# EasyEDA Pro project esp-college-project_bkymsryt-aeef78a5.epro, schematic SCH-ShuttleBoard-BMI270&BMM350-V1_2
Board Name: ShuttleBoard-BMI270&BMM350-V1_1; Create Date: 2025-10-21; Page Name: P1; Project Name: ESP-SensairShuttle; Schematic Name: SCH-ShuttleBoard-BMI270&BMM350-V1_1; Update Date: 2025-10-21; Company: Espressif
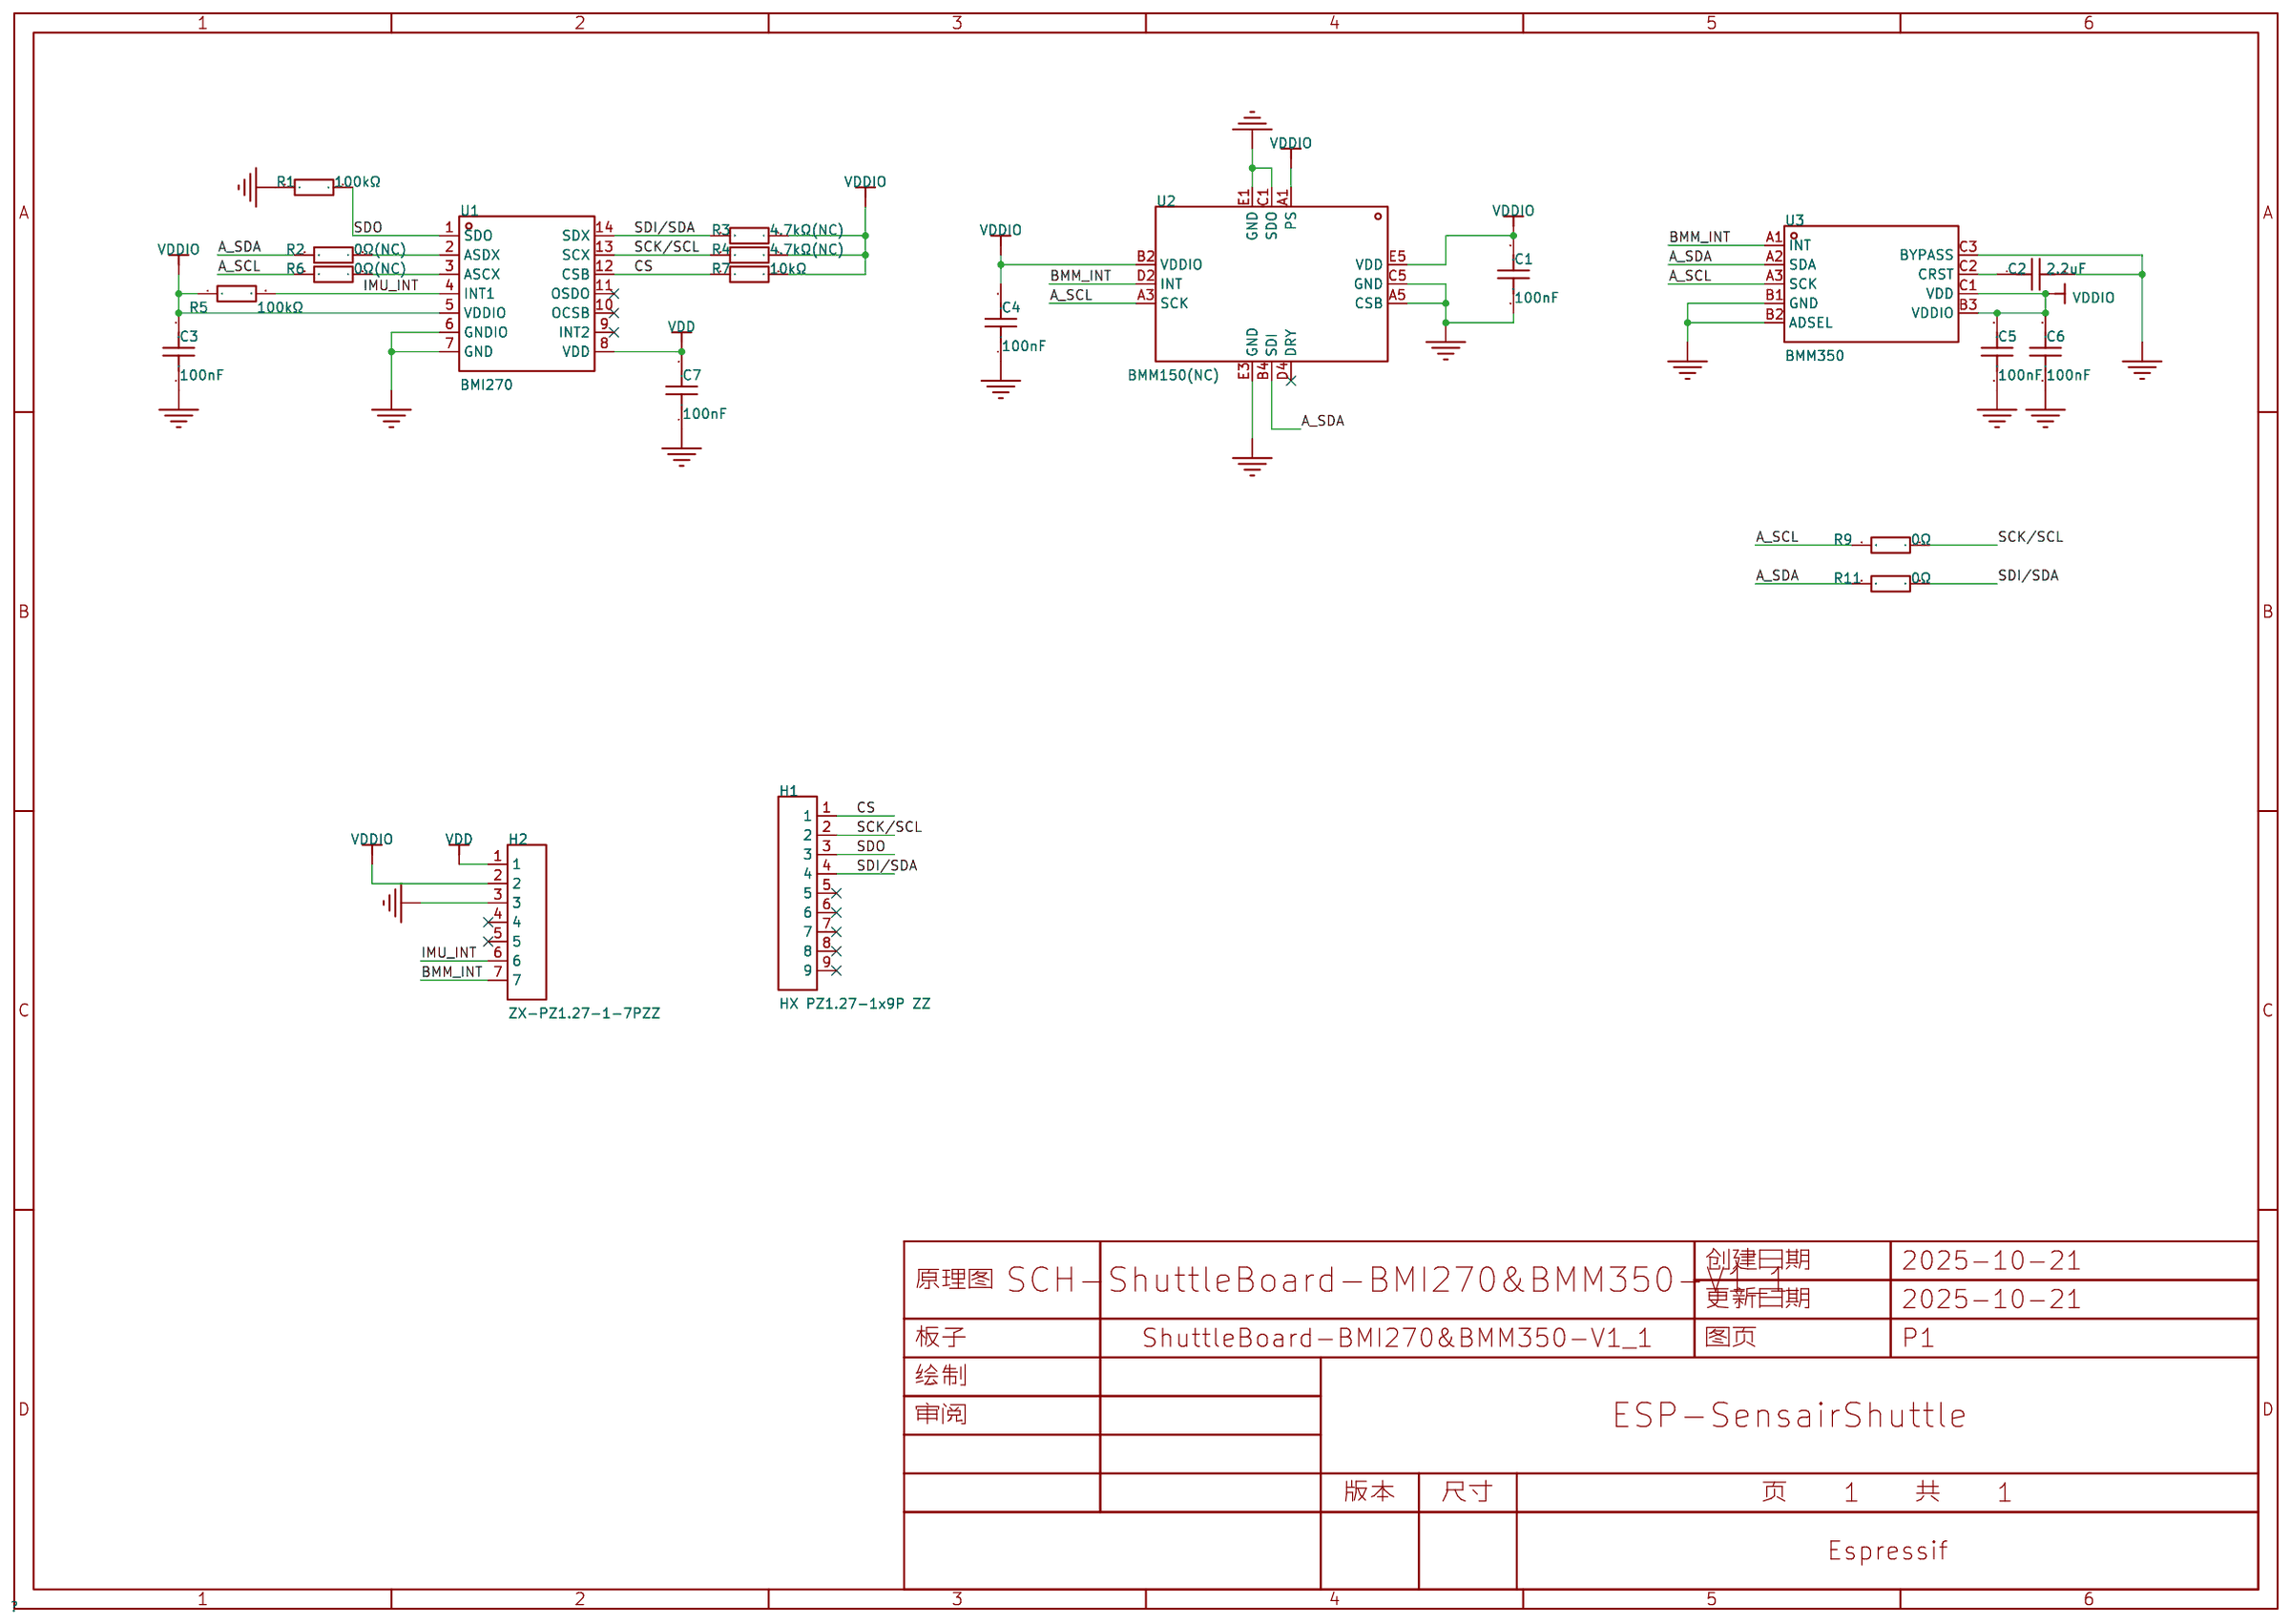
[diagram p0: schematic sheet]

## Parts
C1  100nF  [C0402]
C2  2.2uF  [C0402]
C3  100nF  [C0402]
C4  100nF  [C0402]
C5  100nF  [C0402]
C6  100nF  [C0402]
C7  100nF  [C0402]
H1  HX PZ1.27-1x9P ZZ  [HDR-TH_9P-P1.27-V-M]
H2  ZX-PZ1.27-1-7PZZ  [HDR-TH_7P-P1.27-V-M-2]
R1  100kΩ  [R0402_1]
R2  0Ω(NC)  [R0402_1]
R3  4.7kΩ(NC)  [R0402]
R4  4.7kΩ(NC)  [R0402]
R5  100kΩ  [R0402_1]
R6  0Ω(NC)  [R0402_1]
R7  10kΩ  [R0402_1]
R9  0Ω  [R0402_1]
R11  0Ω  [R0402_1]
U1  BMI270  [LGA-14_L3.0-W2.5-P0.50-BR]
U2  BMM150(NC)  [WLCSP-12_L1.6-W1.6_BMM150]
U3  BMM350  [WLCSP-9_L1.3-W1.3-R3-C3-P0.40-TL]

## Library data of the parts
C1 C3-C7 = CL05B104KO5NNNC: 容值:100nF;精度:±10%;额定电压:16V;材质(温度系数):X7R;; LCSC Part Name: 100nF ±10% 16V; Supplier Part: C1525; Manufacturer: SAMSUNG(三星); Supplier Footprint: 0402; JLCPCB Part Class: 基础库; Datasheet: https://atta.szlcsc.com/upload/public/pdf/source/20160218/1457707763339.pdf; Supplier: LCSC; Tolerance: ±10%; Voltage Rated: 16V; Temperature Coefficient: X7R
C2 = CL05A225MQ5NSNC: 容值:2.2uF;精度:±20%;额定电压:6.3V;材质(温度系数):X5R;; LCSC Part Name: 2.2uF ±20% 6.3V; Supplier Part: C12530; Manufacturer: SAMSUNG(三星); Supplier Footprint: 0402; JLCPCB Part Class: Basic Part; Datasheet: https://atta.szlcsc.com/upload/public/pdf/source/20160218/1457707763339.pdf; Supplier: LCSC; Tolerance: ±20%; Voltage Rated: 6.3V; Temperature Coefficient: X5R
H1 = HX PZ1.27-1x9P ZZ: 插针结构:1x9P;间距:1.27mm;行距:-;圆针/方针:方针;安装方式:直插;排数:单排;总PIN位数:9P;额定电流:1A;额定电压:-;配合针长度:3.9mm;塑高:1mm;端接针长度:2.3mm;触头材质:磷青铜;触头镀层:金;工作温度:-40℃~+105℃;颜色:黑色;; LCSC Part Name: 1x9P 间距:1.27mm 方针 直插; Supplier Part: C22438106; Manufacturer: hanxia(韩下); Supplier Footprint: 插件,P=1.27mm; JLCPCB Part Class: 扩展库; Datasheet: https://atta.szlcsc.com/upload/public/pdf/source/20240522/EDC4EB74ABA2F7724AE2DA5150C3160E.pdf; Supplier: LCSC; Pin Structure: 1x9P; Pitch: 1.27mm; Circluar Pins/Square Pins: 方针; Mounting Type: 直插; Number of Rows: 单排; Number of Pins: 9P; Current Rating: 1A; Length of Mating Pin: 3.9mm; Insulation Height: 1mm; Length of End Connection Pin: 2.3mm; Contact Material: 磷青铜; Contact Plating: 金; Operating Temperature: -40℃~+105℃; Color: 黑色
H2 = ZX-PZ1.27-1-7PZZ: 插针结构:1x7P;间距:1.27mm;行距:-;圆针/方针:方针;安装方式:直插;排数:单排;总PIN位数:7P;额定电流:1A;额定电压:-;配合针长度:3.9mm;塑高:1mm;端接针长度:2.3mm;触头材质:黄铜;触头镀层:金;工作温度:-40℃~+105℃;颜色:黑色;; LCSC Part Name: 1x7P 间距:1.27mm 方针 直插; Supplier Part: C41370739; Manufacturer: Megastar(兆星); Supplier Footprint: 插件,P=1.27mm; JLCPCB Part Class: 扩展库; Datasheet: https://atta.szlcsc.com/upload/public/pdf/source/20240828/99A84DD00A3C3BDAF37BC6A7479E534F.pdf; Supplier: LCSC; Pin Structure: 1x7P; Pitch: 1.27mm; Circluar Pins/Square Pins: 方针; Mounting Type: 直插; Number of Rows: 单排; Number of Pins: 7P; Current Rating: 1A; Length of Mating Pin: 3.9mm; Insulation Height: 1mm; Length of End Connection Pin: 2.3mm; Contact Material: 黄铜; Contact Plating: 金; Operating Temperature: -40℃~+105℃; Color: 黑色
R1 R5 = 0402WGF1003TCE: 电阻类型:厚膜电阻;阻值:100kΩ;精度:±1%;功率:62.5mW;最大工作电压:50V;温度系数:±100ppm/℃;; LCSC Part Name: 100kΩ ±1% 62.5mW 厚膜电阻; Supplier Part: C25741; Manufacturer: UNI-ROYAL(厚声); Supplier Footprint: 0402; JLCPCB Part Class: Basic Part; Datasheet: https://atta.szlcsc.com/upload/public/pdf/source/20200306/C422600_1E6D84923E4A46A82E41ADD87F860B5C.pdf; Supplier: LCSC; Type: 厚膜电阻; Tolerance: ±1%; Power(Watts): 62.5mW; Temperature Coefficient: ±100ppm/℃; Overload Voltage (Max): 50V; Operating Temperature Range: -55℃~+155℃; Check: false
R2 R6 = 0402WGF0000TCE: 电阻类型:厚膜电阻;阻值:0Ω;精度:±1%;功率:62.5mW;工作电压:50V;温度系数:±800ppm/℃;; LCSC Part Name: 0Ω ±1% 62.5mW 厚膜电阻; Supplier Part: C17168; Manufacturer: UNI-ROYAL(厚声); Supplier Footprint: 0402; JLCPCB Part Class: Basic Part; Datasheet: https://atta.szlcsc.com/upload/public/pdf/source/20200306/C422600_1E6D84923E4A46A82E41ADD87F860B5C.pdf; Supplier: LCSC; Type: 厚膜电阻; Tolerance: ±1%; Power(Watts): 62.5mW; Temperature Coefficient: ±800ppm/℃; Overload Voltage (Max): 50V; Operating Temperature Range: -55℃~+155℃; Voltage-Supply(Max): 50V; Operating Temperature: -55℃~+155℃; Check: false
R3 R4 = 0402WGF4701TCE: 电阻类型:厚膜电阻;阻值:4.7kΩ;精度:±1%;功率:62.5mW;工作电压:50V;温度系数:±100ppm/℃;; LCSC Part Name: 4.7kΩ ±1% 62.5mW 厚膜电阻; Supplier Part: C25900; Manufacturer: UNI-ROYAL(厚声); Supplier Footprint: 0402; JLCPCB Part Class: Basic Part; Datasheet: https://item.szlcsc.com/datasheet/0402WGF4701TCE/26643.html; Supplier: LCSC; Type: 厚膜电阻; Tolerance: ±1%; Power(Watts): 62.5mW; Overload Voltage (Max): 50V; Temperature Coefficient: ±100ppm/℃; Operating Temperature Range: -55℃~+155℃; Voltage-Supply(Max): 50V; Operating Temperature: -55℃~+155℃; Check: false
R7 = 0402WGF1002TCE: 电阻类型:厚膜电阻;阻值:10kΩ;精度:±1%;功率:62.5mW;最大工作电压:50V;温度系数:±100ppm/℃;; LCSC Part Name: 厚膜电阻 10kΩ ±1% 62.5mW; Supplier Part: C25744; Manufacturer: UNI-ROYAL(厚声); Supplier Footprint: 0402; JLCPCB Part Class: Basic Part; Datasheet: https://atta.szlcsc.com/upload/public/pdf/source/20200306/C422600_1E6D84923E4A46A82E41ADD87F860B5C.pdf; Supplier: LCSC; Type: 厚膜电阻; Tolerance: ±1%; Power(Watts): 62.5mW; Temperature Coefficient: ±100ppm/℃; Overload Voltage (Max): 50V; Operating Temperature Range: -55℃~+155℃
R9 R11 = 0402WGF0000TCE: 电阻类型:厚膜电阻;阻值:0Ω;精度:±1%;功率:62.5mW;工作电压:50V;温度系数:±800ppm/℃;; LCSC Part Name: 0Ω ±1% 62.5mW; Supplier Part: C17168; Manufacturer: UNI-ROYAL(厚声); Supplier Footprint: 0402; JLCPCB Part Class: Basic Part; Datasheet: https://atta.szlcsc.com/upload/public/pdf/source/20200306/C422600_1E6D84923E4A46A82E41ADD87F860B5C.pdf; Supplier: LCSC; Type: 厚膜电阻; Tolerance: ±1%; Power(Watts): 62.5mW; Temperature Coefficient: ±800ppm/℃; Overload Voltage (Max): 50V; Operating Temperature Range: -55℃~+155℃; Voltage-Supply(Max): 50V; Operating Temperature: -55℃~+155℃
U1 = BMI270: 传感器类型:加速度计陀螺仪;; Supplier Part: C2836813; Manufacturer: Bosch(博世); Supplier Footprint: LGA-14(2.5x3); JLCPCB Part Class: 扩展库; Datasheet: https://atta.szlcsc.com/upload/public/pdf/source/20210625/C2836813_35E1F3F92097F45A3828DF13DDBA01A5.pdf; Supplier: LCSC; Sensor Type: 加速度计陀螺仪; Operating Temperature: -40℃~+85℃
U2 = BMM150: 磁传感器 3轴磁罗盘; LCSC Part Name: 三轴地磁式传感器 停产; Supplier Part: C171681; Manufacturer: Bosch(博世); Supplier Footprint: WLCSP-12(1.6x1.6); JLCPCB Part Class: 扩展库; Datasheet: https://atta.szlcsc.com/upload/public/pdf/source/20180327/C171681_AC95244FE88EF9D8F701E0ABF38F9AC1.pdf; Supplier: LCSC; Check: false
U3 = BMM350_C17225907: LCSC Part Name: SHUTTLE BOARD 3.0 BMM350; Supplier Part: C17225907; Manufacturer: Bosch(博世); JLCPCB Part Class: 扩展库; Datasheet: https://atta.szlcsc.com/upload/public/pdf/source/231023/C17225907-4fe553158356ca54352d40639207ed12.pdf; Supplier: LCSC

## Nets
GND: C1.1 C2.2 C3.1 C4.1 C5.1 C6.1 C7.1 H2.3 R1.1 U1.6(GNDIO) U1.7(GND) U2.A5(CSB) U2.C1(SDO) U2.C5(GND) U2.E1(GND) U2.E3(GND) U3.B1(GND) U3.B2(ADSEL) U3.C3(BYPASS)
VDD: C7.2 H2.1 U1.8(VDD)
VDDIO: C1.2 C3.2 C4.2 C5.2 C6.2 H2.2 R3.1 R4.1 R5.1 R7.2 U1.5(VDDIO) U2.A1(PS) U2.B2(VDDIO) U2.E5(VDD) U3.B3(VDDIO) U3.C1(VDD)
A_SCL: R6.2 R9.2 U2.A3(SCK) U3.A3(SCK)
A_SDA: R2.2 R11.2 U2.B4(SDI) U3.A2(SDA)
BMM_INT: H2.7 U2.D2(INT) U3.A1(INT)
CS: H1.1 R7.1 U1.12(CSB)
IMU_INT: H2.6 R5.2 U1.4(INT1)
SCK/SCL: H1.2 R4.2 R9.1 U1.13(SCX)
SDI/SDA: H1.4 R3.2 R11.1 U1.14(SDX)
SDO: H1.3 R1.2 U1.1(SDO)
$1N576: R6.1 U1.3(ASCX)
$1N584: R2.1 U1.2(ASDX)
$1N2196: C2.1 U3.C2(CRST)

Not connected (* = marked no-connect by the designer): H1 5* 6* 7* 8* 9*; H2 4* 5*; U1 9(INT2)* 10(OCSB)* 11(OSDO)*; U2 D4(DRY)*
